# Altium schematic sheet Schematic1_3.SchDoc (part 2 of 3)
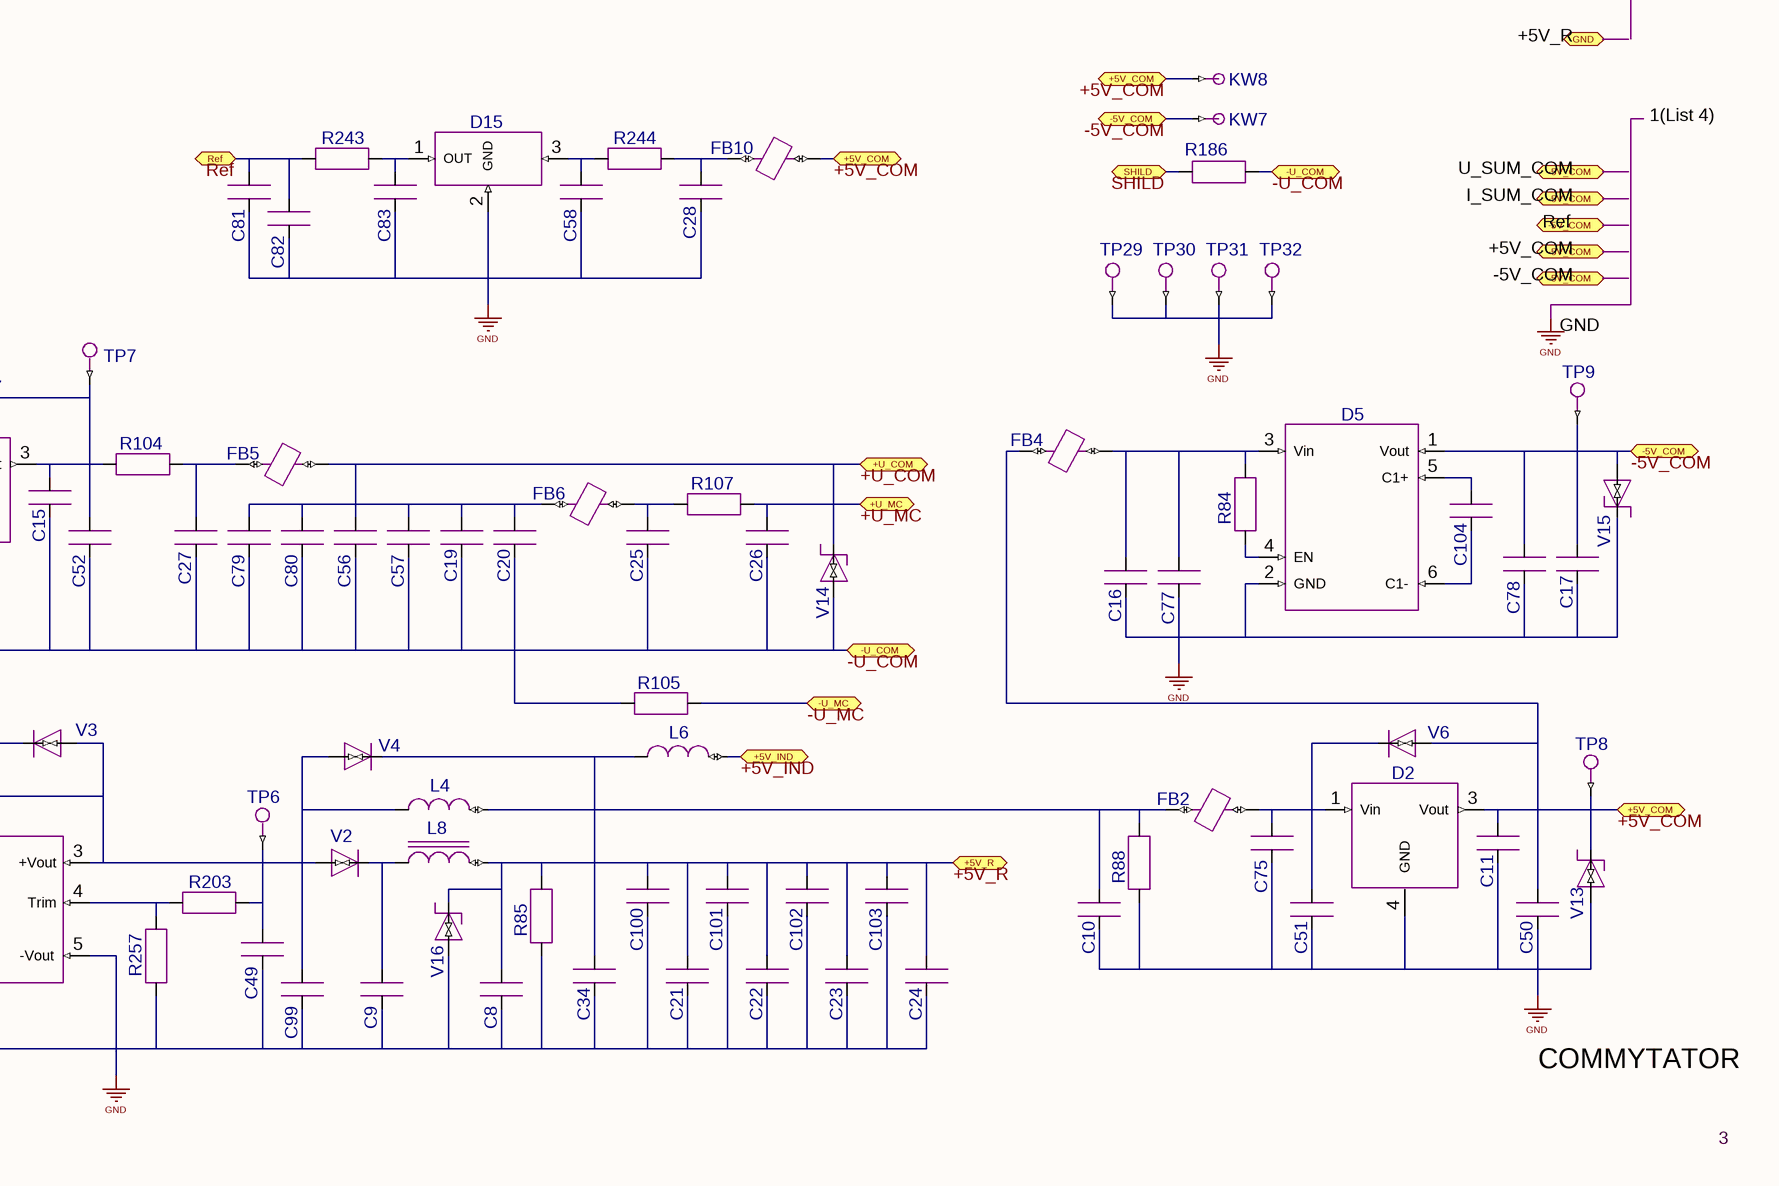
[diagram p3: Schematic1_3.SchDoc, bottom right]
## Library data of the parts
C8 = CAP CER 0.1UF 50V 10% X7R 0603: CL10B104KB8SFNC; Part Label: 100nF VIP; Cell Name: 0603-STANDART-1608; CmpIndex: 20; Ref Designator: C8; Symbol name: C-SXEM-1.1; SymIndex: 6; Part Name: CAP CER 0.1UF 50V 10% X7R 0603; Part Number: CL10B104KB8SFNC
C9 = CAP CER 0.1UF 50V 10% X7R 0603: CL10B104KB8SFNC; Part Label: 100nF VIP; Cell Name: 0603-STANDART-1608; CmpIndex: 76; Ref Designator: C9; Symbol name: C-SXEM-1.1; SymIndex: 6; Part Name: CAP CER 0.1UF 50V 10% X7R 0603; Part Number: CL10B104KB8SFNC
C10 = CAP CER 0.1UF 50V 10% X7R 0603: CL10B104KB8SFNC; Part Label: 100nF VIP; Cell Name: 0603-STANDART-1608; CmpIndex: 82; Ref Designator: C10; Symbol name: C-SXEM-1.1; SymIndex: 6; Part Name: CAP CER 0.1UF 50V 10% X7R 0603; Part Number: CL10B104KB8SFNC
C11 = CAP CER 0.1UF 50V 10% X7R 0603: CL10B104KB8SFNC; Part Label: 100nF VIP; Cell Name: 0603-STANDART-1608; CmpIndex: 87; Ref Designator: C11; Symbol name: C-SXEM-1.1; SymIndex: 6; Part Name: CAP CER 0.1UF 50V 10% X7R 0603; Part Number: CL10B104KB8SFNC
C12 = CAP CER 0.1UF 50V 10% X7R 0603: CL10B104KB8SFNC; Part Label: 100nF VIP; Cell Name: 0603-STANDART-1608; CmpIndex: 103; Ref Designator: C12; Symbol name: C-SXEM-1.1; SymIndex: 6; Part Name: CAP CER 0.1UF 50V 10% X7R 0603; Part Number: CL10B104KB8SFNC
C13 = CAP CER 0.1UF 50V 10% X7R 0603: CL10B104KB8SFNC; Part Label: 100nF VIP; Cell Name: 0603-STANDART-1608; CmpIndex: 104; Ref Designator: C13; Symbol name: C-SXEM-1.1; SymIndex: 6; Part Name: CAP CER 0.1UF 50V 10% X7R 0603; Part Number: CL10B104KB8SFNC
C14 = CAP CER 0.1UF 50V 10% X7R 0603: CL10B104KB8SFNC; Part Label: 100nF VIP; Cell Name: 0603-STANDART-1608; CmpIndex: 105; Ref Designator: C14; Symbol name: C-SXEM-1.1; SymIndex: 6; Part Name: CAP CER 0.1UF 50V 10% X7R 0603; Part Number: CL10B104KB8SFNC
C15 = CAP CER 0.1UF 50V 10% X7R 0603: CL10B104KB8SFNC; Part Label: 100nF VIP; Cell Name: 0603-STANDART-1608; CmpIndex: 113; Ref Designator: C15; Symbol name: C-SXEM-1.1; SymIndex: 6; Part Name: CAP CER 0.1UF 50V 10% X7R 0603; Part Number: CL10B104KB8SFNC
C16 = CAP CER 0.1UF 50V 10% X7R 0603: CL10B104KB8SFNC; Part Label: 100nF VIP; Cell Name: 0603-STANDART-1608; CmpIndex: 119; Ref Designator: C16; Symbol name: C-SXEM-1.1; SymIndex: 6; Part Name: CAP CER 0.1UF 50V 10% X7R 0603; Part Number: CL10B104KB8SFNC
C17 = CAP CER 0.1UF 50V 10% X7R 0603: CL10B104KB8SFNC; Part Label: 100nF VIP; Cell Name: 0603-STANDART-1608; CmpIndex: 120; Ref Designator: C17; Symbol name: C-SXEM-1.1; SymIndex: 6; Part Name: CAP CER 0.1UF 50V 10% X7R 0603; Part Number: CL10B104KB8SFNC
C18 = CAP CER 0.1UF 50V 10% X7R 0603: CL10B104KB8SFNC; Part Label: 100nF VIP; Cell Name: 0603-STANDART-1608; CmpIndex: 129; Ref Designator: C18; Symbol name: C-SXEM-1.1; SymIndex: 6; Part Name: CAP CER 0.1UF 50V 10% X7R 0603; Part Number: CL10B104KB8SFNC
C19 = CAP CER 0.1UF 50V 10% X7R 0603: CL10B104KB8SFNC; Part Label: 100nF VIP; Cell Name: 0603-STANDART-1608; CmpIndex: 184; Ref Designator: C19; Symbol name: C-SXEM-1.1; SymIndex: 6; Part Name: CAP CER 0.1UF 50V 10% X7R 0603; Part Number: CL10B104KB8SFNC
C20 = CAP CER 0.1UF 50V 10% X7R 0603: CL10B104KB8SFNC; Part Label: 100nF VIP; Cell Name: 0603-STANDART-1608; CmpIndex: 190; Ref Designator: C20; Symbol name: C-SXEM-1.1; SymIndex: 6; Part Name: CAP CER 0.1UF 50V 10% X7R 0603; Part Number: CL10B104KB8SFNC
C21 = CAP CER 0.1UF 50V 10% X7R 0603: CL10B104KB8SFNC; Part Label: 100nF VIP; Cell Name: 0603-STANDART-1608; CmpIndex: 213; Ref Designator: C21; Symbol name: C-SXEM-1.1; SymIndex: 6; Part Name: CAP CER 0.1UF 50V 10% X7R 0603; Part Number: CL10B104KB8SFNC
C22 = CAP CER 0.1UF 50V 10% X7R 0603: CL10B104KB8SFNC; Part Label: 100nF VIP; Cell Name: 0603-STANDART-1608; CmpIndex: 214; Ref Designator: C22; Symbol name: C-SXEM-1.1; SymIndex: 6; Part Name: CAP CER 0.1UF 50V 10% X7R 0603; Part Number: CL10B104KB8SFNC
C23 = CAP CER 0.1UF 50V 10% X7R 0603: CL10B104KB8SFNC; Part Label: 100nF VIP; Cell Name: 0603-STANDART-1608; CmpIndex: 215; Ref Designator: C23; Symbol name: C-SXEM-1.1; SymIndex: 6; Part Name: CAP CER 0.1UF 50V 10% X7R 0603; Part Number: CL10B104KB8SFNC
C24 = CAP CER 0.1UF 50V 10% X7R 0603: CL10B104KB8SFNC; Part Label: 100nF VIP; Cell Name: 0603-STANDART-1608; CmpIndex: 216; Ref Designator: C24; Symbol name: C-SXEM-1.1; SymIndex: 6; Part Name: CAP CER 0.1UF 50V 10% X7R 0603; Part Number: CL10B104KB8SFNC
C25 = CAP CER 0.1UF 50V 10% X7R 0603: CL10B104KB8SFNC; Part Label: 100nF VIP; Cell Name: 0603-STANDART-1608; CmpIndex: 217; Ref Designator: C25; Symbol name: C-SXEM-1.1; SymIndex: 6; Part Name: CAP CER 0.1UF 50V 10% X7R 0603; Part Number: CL10B104KB8SFNC
C26 = CAP CER 0.1UF 50V 10% X7R 0603: CL10B104KB8SFNC; Part Label: 100nF VIP; Cell Name: 0603-STANDART-1608; CmpIndex: 218; Ref Designator: C26; Symbol name: C-SXEM-1.1; SymIndex: 6; Part Name: CAP CER 0.1UF 50V 10% X7R 0603; Part Number: CL10B104KB8SFNC
C27 = CAP CER 0.1UF 50V 10% X7R 0603: CL10B104KB8SFNC; Part Label: 100nF VIP; Cell Name: 0603-STANDART-1608; CmpIndex: 219; Ref Designator: C27; Symbol name: C-SXEM-1.1; SymIndex: 6; Part Name: CAP CER 0.1UF 50V 10% X7R 0603; Part Number: CL10B104KB8SFNC
C28 = CAP CER 0.1UF 50V 10% X7R 0603: CL10B104KB8SFNC; Part Label: 100nF VIP; Cell Name: 0603-STANDART-1608; CmpIndex: 237; Ref Designator: C28; Symbol name: C-SXEM-1.1; SymIndex: 6; Part Name: CAP CER 0.1UF 50V 10% X7R 0603; Part Number: CL10B104KB8SFNC
C29 = CAP CER 0.1UF 50V 10% X7R 0603: CL10B104KB8SFNC; Part Label: 100nF VIP; Cell Name: 0603-STANDART-1608; CmpIndex: 835; Ref Designator: C29; Symbol name: C-SXEM-1.1; SymIndex: 6; Part Name: CAP CER 0.1UF 50V 10% X7R 0603; Part Number: CL10B104KB8SFNC
C30 = CAP CER 0.1UF 50V 10% X7R 0603: CL10B104KB8SFNC; Part Label: 100nF VIP; Cell Name: 0603-STANDART-1608; CmpIndex: 1016; Ref Designator: C30; Symbol name: C-SXEM-1.1; SymIndex: 6; Part Name: CAP CER 0.1UF 50V 10% X7R 0603; Part Number: CL10B104KB8SFNC
C31 = CAP CER 0.1UF 50V 10% X7R 0603: CL10B104KB8SFNC; Part Label: 100nF VIP; Cell Name: 0603-STANDART-1608; CmpIndex: 1018; Ref Designator: C31; Symbol name: C-SXEM-1.1; SymIndex: 6; Part Name: CAP CER 0.1UF 50V 10% X7R 0603; Part Number: CL10B104KB8SFNC
C32 = CAP CER 0.1UF 50V 10% X7R 0603: CL10B104KB8SFNC; Part Label: 100nF VIP; Cell Name: 0603-STANDART-1608; CmpIndex: 1035; Ref Designator: C32; Symbol name: C-SXEM-1.1; SymIndex: 6; Part Name: CAP CER 0.1UF 50V 10% X7R 0603; Part Number: CL10B104KB8SFNC
C33 = CAP CER 0.1UF 50V 10% X7R 0603: CL10B104KB8SFNC; Part Label: 100nF VIP; Cell Name: 0603-STANDART-1608; CmpIndex: 1042; Ref Designator: C33; Symbol name: C-SXEM-1.1; SymIndex: 6; Part Name: CAP CER 0.1UF 50V 10% X7R 0603; Part Number: CL10B104KB8SFNC
C34 = CAP CER 0.1UF 50V 10% X7R 0603: CL10B104KB8SFNC; Part Label: 100nF VIP; Cell Name: 0603-STANDART-1608; CmpIndex: 1048; Ref Designator: C34; Symbol name: C-SXEM-1.1; SymIndex: 6; Part Name: CAP CER 0.1UF 50V 10% X7R 0603; Part Number: CL10B104KB8SFNC
C35 = CAP CER 0.1UF 50V 10% X7R 0603: CL10B104KB8SFNC; Part Label: 100nF VIP; Cell Name: 0603-STANDART-1608; CmpIndex: 1374; Ref Designator: C35; Symbol name: C-SXEM-1.1; SymIndex: 6; Part Name: CAP CER 0.1UF 50V 10% X7R 0603; Part Number: CL10B104KB8SFNC
C49 = CAP CER 2.2UF 16V 10% X7R 0805: CL21B225KOFNNNE; Part Label: 2,2u VIP; Cell Name: 0805-STANDART-2012; CmpIndex: 22; Ref Designator: C49; Symbol name: C-SXEM-1.1; SymIndex: 6; Part Name: CAP CER 2.2UF 16V 10% X7R 0805; Part Number: CL21B225KOFNNNE
C50 = CAP CER 2.2UF 16V 10% X7R 0805: CL21B225KOFNNNE; Part Label: 2,2u VIP; Cell Name: 0805-STANDART-2012; CmpIndex: 83; Ref Designator: C50; Symbol name: C-SXEM-1.1; SymIndex: 6; Part Name: CAP CER 2.2UF 16V 10% X7R 0805; Part Number: CL21B225KOFNNNE
C51 = CAP CER 2.2UF 16V 10% X7R 0805: CL21B225KOFNNNE; Part Label: 2,2u VIP; Cell Name: 0805-STANDART-2012; CmpIndex: 84; Ref Designator: C51; Symbol name: C-SXEM-1.1; SymIndex: 6; Part Name: CAP CER 2.2UF 16V 10% X7R 0805; Part Number: CL21B225KOFNNNE
C52 = CAP CER 2.2UF 16V 10% X7R 0805: CL21B225KOFNNNE; Part Label: 2,2u VIP; Cell Name: 0805-STANDART-2012; CmpIndex: 106; Ref Designator: C52; Symbol name: C-SXEM-1.1; SymIndex: 6; Part Name: CAP CER 2.2UF 16V 10% X7R 0805; Part Number: CL21B225KOFNNNE
C53 = CAP CER 2.2UF 16V 10% X7R 0805: CL21B225KOFNNNE; Part Label: 2,2u VIP; Cell Name: 0805-STANDART-2012; CmpIndex: 107; Ref Designator: C53; Symbol name: C-SXEM-1.1; SymIndex: 6; Part Name: CAP CER 2.2UF 16V 10% X7R 0805; Part Number: CL21B225KOFNNNE
C54 = CAP CER 2.2UF 16V 10% X7R 0805: CL21B225KOFNNNE; Part Label: 2,2u VIP; Cell Name: 0805-STANDART-2012; CmpIndex: 108; Ref Designator: C54; Symbol name: C-SXEM-1.1; SymIndex: 6; Part Name: CAP CER 2.2UF 16V 10% X7R 0805; Part Number: CL21B225KOFNNNE
C55 = CAP CER 2.2UF 16V 10% X7R 0805: CL21B225KOFNNNE; Part Label: 2,2u VIP; Cell Name: 0805-STANDART-2012; CmpIndex: 109; Ref Designator: C55; Symbol name: C-SXEM-1.1; SymIndex: 6; Part Name: CAP CER 2.2UF 16V 10% X7R 0805; Part Number: CL21B225KOFNNNE
C56 = CAP CER 2.2UF 16V 10% X7R 0805: CL21B225KOFNNNE; Part Label: 2,2u VIP; Cell Name: 0805-STANDART-2012; CmpIndex: 182; Ref Designator: C56; Symbol name: C-SXEM-1.1; SymIndex: 6; Part Name: CAP CER 2.2UF 16V 10% X7R 0805; Part Number: CL21B225KOFNNNE
C57 = CAP CER 2.2UF 16V 10% X7R 0805: CL21B225KOFNNNE; Part Label: 2,2u VIP; Cell Name: 0805-STANDART-2012; CmpIndex: 189; Ref Designator: C57; Symbol name: C-SXEM-1.1; SymIndex: 6; Part Name: CAP CER 2.2UF 16V 10% X7R 0805; Part Number: CL21B225KOFNNNE
C58 = CAP CER 2.2UF 16V 10% X7R 0805: CL21B225KOFNNNE; Part Label: 2,2u VIP; Cell Name: 0805-STANDART-2012; CmpIndex: 238; Ref Designator: C58; Symbol name: C-SXEM-1.1; SymIndex: 6; Part Name: CAP CER 2.2UF 16V 10% X7R 0805; Part Number: CL21B225KOFNNNE
C59 = CAP CER 2.2UF 16V 10% X7R 0805: CL21B225KOFNNNE; Part Label: 2,2u VIP; Cell Name: 0805-STANDART-2012; CmpIndex: 1033; Ref Designator: C59; Symbol name: C-SXEM-1.1; SymIndex: 6; Part Name: CAP CER 2.2UF 16V 10% X7R 0805; Part Number: CL21B225KOFNNNE
C60 = CAP CER 2.2UF 16V 10% X7R 0805: CL21B225KOFNNNE; Part Label: 2,2u VIP; Cell Name: 0805-STANDART-2012; CmpIndex: 1034; Ref Designator: C60; Symbol name: C-SXEM-1.1; SymIndex: 6; Part Name: CAP CER 2.2UF 16V 10% X7R 0805; Part Number: CL21B225KOFNNNE
C61 = CAP CER 2.2UF 16V 10% X7R 0805: CL21B225KOFNNNE; Part Label: 2,2u VIP; Cell Name: 0805-STANDART-2012; CmpIndex: 1041; Ref Designator: C61; Symbol name: C-SXEM-1.1; SymIndex: 6; Part Name: CAP CER 2.2UF 16V 10% X7R 0805; Part Number: CL21B225KOFNNNE
C62 = CAP CER 2.2UF 16V 10% X7R 0805: CL21B225KOFNNNE; Part Label: 2,2u VIP; Cell Name: 0805-STANDART-2012; CmpIndex: 1355; Ref Designator: C62; Symbol name: C-SXEM-1.1; SymIndex: 6; Part Name: CAP CER 2.2UF 16V 10% X7R 0805; Part Number: CL21B225KOFNNNE
C63 = CAP CER 2.2UF 16V 10% X7R 0805: CL21B225KOFNNNE; Part Label: 2,2u VIP; Cell Name: 0805-STANDART-2012; CmpIndex: 426; Ref Designator: C63; Symbol name: C-SXEM-1.1; SymIndex: 6; Part Name: CAP CER 2.2UF 16V 10% X7R 0805; Part Number: CL21B225KOFNNNE
C64 = CAP CER 1000PF 3KV 10% X7R 1808: C1808X102KHRACTU; Part Label: 1nF/3000V; Cell Name: 1808-STANDART-4520; CmpIndex: 25; Ref Designator: C64; Symbol name: C-SXEM-1.1; SymIndex: 6; Part Name: CAP CER 1000PF 3KV 10% X7R 1808; Part Number: C1808X102KHRACTU
C65 = CAP CER 1000PF 3KV 10% X7R 1808: C1808X102KHRACTU; Part Label: 1nF/3000V; Cell Name: 1808-STANDART-4520; CmpIndex: 26; Ref Designator: C65; Symbol name: C-SXEM-1.1; SymIndex: 6; Part Name: CAP CER 1000PF 3KV 10% X7R 1808; Part Number: C1808X102KHRACTU
C66 = CAP CER 0.1UF 100V X7R 1206: C1206C104K1RACTU; Part Label: 0,1uF/100V; Cell Name: 1206-STANDART-3216; CmpIndex: 68; Ref Designator: C66; Symbol name: C-SXEM-1.1; SymIndex: 6; Part Name: CAP CER 0.1UF 100V X7R 1206; Part Number: C1206C104K1RACTU
C67 = CAP CER 0.1UF 100V X7R 1206: C1206C104K1RACTU; Part Label: 0,1uF/100V; Cell Name: 1206-STANDART-3216; CmpIndex: 69; Ref Designator: C67; Symbol name: C-SXEM-1.1; SymIndex: 6; Part Name: CAP CER 0.1UF 100V X7R 1206; Part Number: C1206C104K1RACTU
C68 = CAP CER 0.1UF 100V X7R 1206: C1206C104K1RACTU; Part Label: 0,1uF/100V; Cell Name: 1206-STANDART-3216; CmpIndex: 70; Ref Designator: C68; Symbol name: C-SXEM-1.1; SymIndex: 6; Part Name: CAP CER 0.1UF 100V X7R 1206; Part Number: C1206C104K1RACTU
C69 = CAP CER 0.1UF 100V X7R 1206: C1206C104K1RACTU; Part Label: 0,1uF/100V; Cell Name: 1206-STANDART-3216; CmpIndex: 71; Ref Designator: C69; Symbol name: C-SXEM-1.1; SymIndex: 6; Part Name: CAP CER 0.1UF 100V X7R 1206; Part Number: C1206C104K1RACTU
C70 = CAP CER 4.7UF 100V X7R 1210: CL32B475KCVZW6E; Part Label: 4,7uF/100V; Cell Name: 1210-STANDART-3225; CmpIndex: 73; Ref Designator: C70; Symbol name: C-SXEM-1.1; SymIndex: 6; Part Name: CAP CER 4.7UF 100V X7R 1210; Part Number: CL32B475KCVZW6E
C71 = CAP CER 4.7UF 100V X7R 1210: CL32B475KCVZW6E; Part Label: 4,7uF/100V; Cell Name: 1210-STANDART-3225; CmpIndex: 74; Ref Designator: C71; Symbol name: C-SXEM-1.1; SymIndex: 6; Part Name: CAP CER 4.7UF 100V X7R 1210; Part Number: CL32B475KCVZW6E
C75 = CAP CER 10UF 16V 10% X7R 0805: CL21B106KOQNNNE; Part Label: 10uF VIP; Cell Name: 0805-STANDART-2012; CmpIndex: 86; Ref Designator: C75; Symbol name: C-SXEM-1.1; SymIndex: 6; Part Name: CAP CER 10UF 16V 10% X7R 0805; Part Number: CL21B106KOQNNNE
C76 = CAP CER 10UF 16V 10% X7R 0805: CL21B106KOQNNNE; Part Label: 10uF VIP; Cell Name: 0805-STANDART-2012; CmpIndex: 111; Ref Designator: C76; Symbol name: C-SXEM-1.1; SymIndex: 6; Part Name: CAP CER 10UF 16V 10% X7R 0805; Part Number: CL21B106KOQNNNE
C77 = CAP CER 10UF 16V 10% X7R 0805: CL21B106KOQNNNE; Part Label: 10uF VIP; Cell Name: 0805-STANDART-2012; CmpIndex: 117; Ref Designator: C77; Symbol name: C-SXEM-1.1; SymIndex: 6; Part Name: CAP CER 10UF 16V 10% X7R 0805; Part Number: CL21B106KOQNNNE
C78 = CAP CER 10UF 16V 10% X7R 0805: CL21B106KOQNNNE; Part Label: 10uF VIP; Cell Name: 0805-STANDART-2012; CmpIndex: 118; Ref Designator: C78; Symbol name: C-SXEM-1.1; SymIndex: 6; Part Name: CAP CER 10UF 16V 10% X7R 0805; Part Number: CL21B106KOQNNNE
C79 = CAP CER 10UF 16V 10% X7R 0805: CL21B106KOQNNNE; Part Label: 10uF VIP; Cell Name: 0805-STANDART-2012; CmpIndex: 187; Ref Designator: C79; Symbol name: C-SXEM-1.1; SymIndex: 6; Part Name: CAP CER 10UF 16V 10% X7R 0805; Part Number: CL21B106KOQNNNE
C80 = CAP CER 10UF 16V 10% X7R 0805: CL21B106KOQNNNE; Part Label: 10uF VIP; Cell Name: 0805-STANDART-2012; CmpIndex: 188; Ref Designator: C80; Symbol name: C-SXEM-1.1; SymIndex: 6; Part Name: CAP CER 10UF 16V 10% X7R 0805; Part Number: CL21B106KOQNNNE
C81 = CAP CER 10UF 16V 10% X7R 0805: CL21B106KOQNNNE; Part Label: 10uF VIP; Cell Name: 0805-STANDART-2012; CmpIndex: 241; Ref Designator: C81; Symbol name: C-SXEM-1.1; SymIndex: 6; Part Name: CAP CER 10UF 16V 10% X7R 0805; Part Number: CL21B106KOQNNNE
C82 = CAP CER 10UF 16V 10% X7R 0805: CL21B106KOQNNNE; Part Label: 10uF VIP; Cell Name: 0805-STANDART-2012; CmpIndex: 242; Ref Designator: C82; Symbol name: C-SXEM-1.1; SymIndex: 6; Part Name: CAP CER 10UF 16V 10% X7R 0805; Part Number: CL21B106KOQNNNE
C83 = CAP CER 10UF 16V 10% X7R 0805: CL21B106KOQNNNE; Part Label: 10uF VIP; Cell Name: 0805-STANDART-2012; CmpIndex: 243; Ref Designator: C83; Symbol name: C-SXEM-1.1; SymIndex: 6; Part Name: CAP CER 10UF 16V 10% X7R 0805; Part Number: CL21B106KOQNNNE
C84 = CAP CER 10UF 16V 10% X7R 0805: CL21B106KOQNNNE; Part Label: 10uF VIP; Cell Name: 0805-STANDART-2012; CmpIndex: 836; Ref Designator: C84; Symbol name: C-SXEM-1.1; SymIndex: 6; Part Name: CAP CER 10UF 16V 10% X7R 0805; Part Number: CL21B106KOQNNNE
C85 = CAP CER 10UF 16V 10% X7R 0805: CL21B106KOQNNNE; Part Label: 10uF VIP; Cell Name: 0805-STANDART-2012; CmpIndex: 1017; Ref Designator: C85; Symbol name: C-SXEM-1.1; SymIndex: 6; Part Name: CAP CER 10UF 16V 10% X7R 0805; Part Number: CL21B106KOQNNNE
C86 = CAP CER 10UF 16V 10% X7R 0805: CL21B106KOQNNNE; Part Label: 10uF VIP; Cell Name: 0805-STANDART-2012; CmpIndex: 1375; Ref Designator: C86; Symbol name: C-SXEM-1.1; SymIndex: 6; Part Name: CAP CER 10UF 16V 10% X7R 0805; Part Number: CL21B106KOQNNNE
C98 = CAP CER 10UF 25V 10% X7R 1210: GRM32DR71E106KA12L; Cell Name: 1210-STANDART-3225; CmpIndex: 99; Ref Designator: C98; Symbol name: C-SXEM-1.1; SymIndex: 6; Part Label: 10uF; Part Name: CAP CER 10UF 25V 10% X7R 1210; Part Number: GRM32DR71E106KA12L
C99 = CAP CER 10UF 25V 10% X7R 1210: GRM32DR71E106KA12L; Cell Name: 1210-STANDART-3225; CmpIndex: 114; Ref Designator: C99; Symbol name: C-SXEM-1.1; SymIndex: 6; Part Label: 10uF; Part Name: CAP CER 10UF 25V 10% X7R 1210; Part Number: GRM32DR71E106KA12L
C100 = CAP CER 10UF 25V 10% X7R 1210: GRM32DR71E106KA12L; Cell Name: 1210-STANDART-3225; CmpIndex: 191; Ref Designator: C100; Symbol name: C-SXEM-1.1; SymIndex: 6; Part Label: 10uF; Part Name: CAP CER 10UF 25V 10% X7R 1210; Part Number: GRM32DR71E106KA12L
C101 = CAP CER 10UF 25V 10% X7R 1210: GRM32DR71E106KA12L; Cell Name: 1210-STANDART-3225; CmpIndex: 210; Ref Designator: C101; Symbol name: C-SXEM-1.1; SymIndex: 6; Part Label: 10uF; Part Name: CAP CER 10UF 25V 10% X7R 1210; Part Number: GRM32DR71E106KA12L
C102 = CAP CER 10UF 25V 10% X7R 1210: GRM32DR71E106KA12L; Cell Name: 1210-STANDART-3225; CmpIndex: 211; Ref Designator: C102; Symbol name: C-SXEM-1.1; SymIndex: 6; Part Label: 10uF; Part Name: CAP CER 10UF 25V 10% X7R 1210; Part Number: GRM32DR71E106KA12L
C103 = CAP CER 10UF 25V 10% X7R 1210: GRM32DR71E106KA12L; Cell Name: 1210-STANDART-3225; CmpIndex: 212; Ref Designator: C103; Symbol name: C-SXEM-1.1; SymIndex: 6; Part Label: 10uF; Part Name: CAP CER 10UF 25V 10% X7R 1210; Part Number: GRM32DR71E106KA12L
C104 = CAP CER 1UF 16V 10% X7R 0805: CC0805KKX7R7BB105; Part Label: 1u F VIP; Cell Name: 0805-STANDART-2012; CmpIndex: 123; Ref Designator: C104; Symbol name: C-SXEM-1.1; SymIndex: 6; Part Name: CAP CER 1UF 16V 10% X7R 0805; Part Number: CC0805KKX7R7BB105
C135 = CAP CER 1000PF 50V 5% NP0 0603: GRM1885C1H102JA01D; Part Label: 1nF; Cell Name: 0603-STANDART-1608; CmpIndex: 1014; Ref Designator: C135; Symbol name: C-SXEM-1.1; SymIndex: 6; Part Name: CAP CER 1000PF 50V 5% NP0 0603; Part Number: GRM1885C1H102JA01D
C141 = CAP CER 2200PF 50V 5% NP0 0805: GRM2165C1H222JA01D; Part Label: 2,2nF; Cell Name: 0805-STANDART-2012; CmpIndex: 1019; Ref Designator: C141; Symbol name: C-SXEM-1.1; SymIndex: 6; Part Name: CAP CER 2200PF 50V 5% NP0 0805; Part Number: GRM2165C1H222JA01D
C142 = CAP ALUM 1000UF 63V 20% RADIAL: UHE1H102MHD6_1; Part Label: 1000uF/63V-HE; Cell Name: CAP-EL-L7.5-D18,0; CmpIndex: 1419; Ref Designator: C142; Symbol name: C-SXEM-EL-1.1; SymIndex: 41; Part Name: CAP ALUM 1000UF 63V 20% RADIAL; Part Number: UHE1H102MHD6_1
C143 = CAP ALUM 1000UF 63V 20% RADIAL: UHE1H102MHD6_1; Part Label: 1000uF/63V-HE; Cell Name: CAP-EL-L7.5-D18,0; CmpIndex: 1420; Ref Designator: C143; Symbol name: C-SXEM-EL-1.1; SymIndex: 41; Part Name: CAP ALUM 1000UF 63V 20% RADIAL; Part Number: UHE1H102MHD6_1
D1 = DC/DC CONVERTER 5V 10W: PDQ10-Q48-S5-D; Part Label: 5V/2A_18-75V; Cell Name: THN-30; CmpIndex: 33; Ref Designator: D1; Symbol name: TEN30_TEN20.1; SymIndex: 53; Part Name: DC/DC CONVERTER 5V 10W; Part Number: PDQ10-Q48-S5-D
D2 = IC REG LDO 5V 0.5A DPAK: NCP5501DT50RKG; Part Label: 5V0/0,5A; Cell Name: DPAK-3-TO252-ONSEMI; CmpIndex: 85; Ref Designator: D2; Symbol name: LDO-DPAK-1IN-3OUT-4GND.1; SymIndex: 21; Part Name: IC REG LDO 5V 0.5A DPAK; Part Number: NCP5501DT50RKG
D3 = IC REG LDO 5V 0.5A DPAK: NCP5501DT50RKG; Part Label: 5V0/0,5A; Cell Name: DPAK-3-TO252-ONSEMI; CmpIndex: 110; Ref Designator: D3; Symbol name: LDO-DPAK-1IN-3OUT-4GND.1; SymIndex: 21; Part Name: IC REG LDO 5V 0.5A DPAK; Part Number: NCP5501DT50RKG
D4 = IC REG ISOLATED 7V 286MA 12SOP: DCP020507U; Part Label: 5Vin/7Vout/286mA; Cell Name: DVB-R-PDSO-G12/G28; CmpIndex: 96; Ref Designator: D4; Symbol name: DCP02-SOIC.1; SymIndex: 17; Part Name: IC REG ISOLATED 7V 286MA 12SOP; Part Number: DCP020507U
D5 = IC REG SWTCHD CAP INV 6SOT23: LM2776DBVR; Part Label: -5V; Cell Name: DBV_R-PDSO-G6; CmpIndex: 115; Ref Designator: D5; Symbol name: LM2776.1; SymIndex: 55; Part Name: IC REG SWTCHD CAP INV 6SOT23; Part Number: LM2776DBVR
D6 = IC SWITCH DUAL SPDT 10MSOP: ADG736BRMZ-REEL7; Part Label: +5V/4OHM; Cell Name: MSOP-RM-10-AD; CmpIndex: 232; Ref Designator: D6; Symbol name: ADG736.1; SymIndex: 63; Part Name: IC SWITCH DUAL SPDT 10MSOP; Part Number: ADG736BRMZ-REEL7
D9 = IC GATE AND 1CH 2-INP SOT-23-5: SN74LVC1G08DBVR; Part Label: 5V/32mA; Cell Name: SOT-23-DBV-R-PDSO-G5-TI; CmpIndex: 233; Ref Designator: D9; Symbol name: 1IN_AND_GATE.1; SymIndex: 60; Part Name: IC GATE AND 1CH 2-INP SOT-23-5; Part Number: SN74LVC1G08DBVR
D10 = IC GATE AND 1CH 2-INP SOT-23-5: SN74LVC1G08DBVR; Part Label: 5V/32mA; Cell Name: SOT-23-DBV-R-PDSO-G5-TI; CmpIndex: 1007; Ref Designator: D10; Symbol name: 1IN_AND_GATE.1; SymIndex: 60; Part Name: IC GATE AND 1CH 2-INP SOT-23-5; Part Number: SN74LVC1G08DBVR
D11 = IC GATE AND 1CH 2-INP SOT-23-5: SN74LVC1G08DBVR; Part Label: 5V/32mA; Cell Name: SOT-23-DBV-R-PDSO-G5-TI; CmpIndex: 1027; Ref Designator: D11; Symbol name: 1IN_AND_GATE.1; SymIndex: 60; Part Name: IC GATE AND 1CH 2-INP SOT-23-5; Part Number: SN74LVC1G08DBVR
D12 = IC GATE AND 1CH 2-INP SOT-23-5: SN74LVC1G08DBVR; Part Label: 5V/32mA; Cell Name: SOT-23-DBV-R-PDSO-G5-TI; CmpIndex: 1040; Ref Designator: D12; Symbol name: 1IN_AND_GATE.1; SymIndex: 60; Part Name: IC GATE AND 1CH 2-INP SOT-23-5; Part Number: SN74LVC1G08DBVR
D13 = IC GATE AND 1CH 2-INP SOT-23-5: SN74LVC1G08DBVR; Part Label: 5V/32mA; Cell Name: SOT-23-DBV-R-PDSO-G5-TI; CmpIndex: 1043; Ref Designator: D13; Symbol name: 1IN_AND_GATE.1; SymIndex: 60; Part Name: IC GATE AND 1CH 2-INP SOT-23-5; Part Number: SN74LVC1G08DBVR
D15 = VREF 2.5V 2mV  70uA 50ppm  SOT-23-3: AD1582BRTZ-REEL7; Part Label: 2,5V/50ppm; Cell Name: SOT-23-RT-3-AD; CmpIndex: 239; Ref Designator: D15; Symbol name: AD1582-1585.1; SymIndex: 64; Part Name: VREF 2.5V 2mV  70uA 50ppm  SOT-23-3; Part Number: AD1582BRTZ-REEL7
D22 = IC GATE NAND 1CH 2-INP SOT-23-5: SN74AHCT1G00DBVR; Part Label: 5V/8mA; Cell Name: SOT-23-DBV-R-PDSO-G5-TI; CmpIndex: 1025; Ref Designator: D22; Symbol name: 1IN_NAND_GATE.1; SymIndex: 59; Part Name: IC GATE NAND 1CH 2-INP SOT-23-5; Part Number: SN74AHCT1G00DBVR
D23 = IC GATE NAND 1CH 2-INP SOT-23-5: SN74AHCT1G00DBVR; Part Label: 5V/8mA; Cell Name: SOT-23-DBV-R-PDSO-G5-TI; CmpIndex: 1031; Ref Designator: D23; Symbol name: 1IN_NAND_GATE.1; SymIndex: 59; Part Name: IC GATE NAND 1CH 2-INP SOT-23-5; Part Number: SN74AHCT1G00DBVR
D36 = IC SIMPLE SEQUENCER OD SC70-6: ADM1087AKSZ-REEL7; Part Label: 1K/OPEN; Cell Name: SC-70-KS-6-AD; CmpIndex: 997; Ref Designator: D36; Symbol name: ADM1087-1088.1; SymIndex: 62; Part Name: IC SIMPLE SEQUENCER OD SC70-6; Part Number: ADM1087AKSZ-REEL7
D37 = IC GATE NAND 1CH 2-INP SOT-23-5: SN74LVC1G00DBVR; Part Label: 5V/32mA; CmpIndex: 1020; Ref Designator: D37; Symbol name: 1IN_NAND_GATE.1; SymIndex: 59; Part Name: IC GATE NAND 1CH 2-INP SOT-23-5; Part Number: SN74LVC1G00DBVR
D38 = ERROR_5.30mm Width: SN74ABT245BNSR; Part Label: ERROR_4.4mm Width; Cell Name: PW-R-PDSO-G20; CmpIndex: 1066; Ref Designator: D38; Symbol name: SN74HCT245.1; SymIndex: 29; Part Name: ERROR_5.30mm Width; Part Number: SN74ABT245BNSR
D39 = ERROR_5.30mm Width: SN74ABT245BNSR; Part Label: ERROR_4.4mm Width; Cell Name: PW-R-PDSO-G20; CmpIndex: 1082; Ref Designator: D39; Symbol name: SN74HCT245.1; SymIndex: 29; Part Name: ERROR_5.30mm Width; Part Number: SN74ABT245BNSR
FB2 = FERRITE BEAD 1000 OHM 0,4 A 0603: MMZ1608S102A; Part Label: 1K/0,4A; Cell Name: 0603-STANDART-1608; CmpIndex: 80; Ref Designator: FB2; Symbol name: FERRITE-1.1; SymIndex: 10; Part Name: FERRITE BEAD 1000 OHM 0,4 A 0603; Part Number: MMZ1608S102A
FB3 = FERRITE BEAD 1000 OHM 0,4 A 0603: MMZ1608S102A; Part Label: 1K/0,4A; Cell Name: 0603-STANDART-1608; CmpIndex: 101; Ref Designator: FB3; Symbol name: FERRITE-1.1; SymIndex: 10; Part Name: FERRITE BEAD 1000 OHM 0,4 A 0603; Part Number: MMZ1608S102A
FB4 = FERRITE BEAD 1000 OHM 0,4 A 0603: MMZ1608S102A; Part Label: 1K/0,4A; Cell Name: 0603-STANDART-1608; CmpIndex: 121; Ref Designator: FB4; Symbol name: FERRITE-1.1; SymIndex: 10; Part Name: FERRITE BEAD 1000 OHM 0,4 A 0603; Part Number: MMZ1608S102A
FB5 = FERRITE BEAD 1000 OHM 0,4 A 0603: MMZ1608S102A; Part Label: 1K/0,4A; Cell Name: 0603-STANDART-1608; CmpIndex: 879; Ref Designator: FB5; Symbol name: FERRITE-1.1; SymIndex: 10; Part Name: FERRITE BEAD 1000 OHM 0,4 A 0603; Part Number: MMZ1608S102A
FB6 = FERRITE BEAD 1000 OHM 0,4 A 0603: MMZ1608S102A; Part Label: 1K/0,4A; Cell Name: 0603-STANDART-1608; CmpIndex: 880; Ref Designator: FB6; Symbol name: FERRITE-1.1; SymIndex: 10; Part Name: FERRITE BEAD 1000 OHM 0,4 A 0603; Part Number: MMZ1608S102A
FB7 = FERRITE BEAD 1000 OHM 0,4 A 0603: MMZ1608S102A; Part Label: 1K/0,4A; Cell Name: 0603-STANDART-1608; CmpIndex: 1377; Ref Designator: FB7; Symbol name: FERRITE-1.1; SymIndex: 10; Part Name: FERRITE BEAD 1000 OHM 0,4 A 0603; Part Number: MMZ1608S102A
FB10 = FERRITE BEAD 1800 OHM 0,2 A 0603: MMZ1608A182B; Part Label: 1,8K/0,2A; Cell Name: 0603-STANDART-1608; CmpIndex: 240; Ref Designator: FB10; Symbol name: FERRITE-1.1; SymIndex: 10; Part Name: FERRITE BEAD 1800 OHM 0,2 A 0603; Part Number: MMZ1608A182B
FB11 = FERRITE BEAD 1800 OHM 0,2 A 0603: MMZ1608A182B; Part Label: 1,8K/0,2A; Cell Name: 0603-STANDART-1608; CmpIndex: 1029; Ref Designator: FB11; Symbol name: FERRITE-1.1; SymIndex: 10; Part Name: FERRITE BEAD 1800 OHM 0,2 A 0603; Part Number: MMZ1608A182B
FB12 = FERRITE BEAD 1800 OHM 0,2 A 0603: MMZ1608A182B; Part Label: 1,8K/0,2A; Cell Name: 0603-STANDART-1608; CmpIndex: 1030; Ref Designator: FB12; Symbol name: FERRITE-1.1; SymIndex: 10; Part Name: FERRITE BEAD 1800 OHM 0,2 A 0603; Part Number: MMZ1608A182B
H1 = LED 2X1.2MM 570NM GN WTR CLR SMD: APT2012CGCK; Part Label: GREEN/20mA/50mcd; Cell Name: 0805-STANDART-2012-SVET; CmpIndex: 32; Ref Designator: H1; Symbol name: SVETODIODE_1A_2K.1; SymIndex: 16; Part Name: LED 2X1.2MM 570NM GN WTR CLR SMD; Part Number: APT2012CGCK
H2 = LED 2X1.2MM 570NM GN WTR CLR SMD: APT2012CGCK; Part Label: GREEN/20mA/50mcd; Cell Name: 0805-STANDART-2012-SVET; CmpIndex: 881; Ref Designator: H2; Symbol name: SVETODIODE_1A_2K.1; SymIndex: 16; Part Name: LED 2X1.2MM 570NM GN WTR CLR SMD; Part Number: APT2012CGCK
H3 = LED 2X1.2MM 570NM GN WTR CLR SMD: APT2012CGCK; Part Label: GREEN/20mA/50mcd; Cell Name: 0805-STANDART-2012-SVET; CmpIndex: 884; Ref Designator: H3; Symbol name: SVETODIODE_1A_2K.1; SymIndex: 16; Part Name: LED 2X1.2MM 570NM GN WTR CLR SMD; Part Number: APT2012CGCK
H4 = LED 2X1.2MM 570NM GN WTR CLR SMD: APT2012CGCK; Part Label: GREEN/20mA/50mcd; Cell Name: 0805-STANDART-2012-SVET; CmpIndex: 925; Ref Designator: H4; Symbol name: SVETODIODE_1A_2K.1; SymIndex: 16; Part Name: LED 2X1.2MM 570NM GN WTR CLR SMD; Part Number: APT2012CGCK
H21 = LED 2X1.2MM 640NM RD WTR CLR SMD: APT2012SRCPRV; Part Label: RED/20mA/100mcd; Cell Name: 0805-STANDART-2012-SVET; CmpIndex: 1057; Ref Designator: H21; Symbol name: SVETODIODE_1A_2K.1; SymIndex: 16; Part Name: LED 2X1.2MM 640NM RD WTR CLR SMD; Part Number: APT2012SRCPRV
H22 = White LED Indication - Discrete 3.1V 0805: QBLP631-IW; Part Label: Yellow; Cell Name: 0805-STANDART-2012-SVET; CmpIndex: 1056; Ref Designator: H22; Symbol name: SVETODIODE_1A_2K.1; SymIndex: 16; Part Name: White LED Indication - Discrete 3.1V 0805; Part Number: QBLP631-IW
KW4 = MGSHV-0_12-D1_3xd0.45: CmpIndex: 457; Ref Designator: KW4; Symbol name: KONT-PROVOD.1; SymIndex: 77; Part Name: MGSHV-0_12-D1_3xd0.45; Part Number: MGSHV-0_12-D1_3xd0.45
KW5 = MGSHV-0_12-D1_3xd0.45: CmpIndex: 458; Ref Designator: KW5; Symbol name: KONT-PROVOD.1; SymIndex: 77; Part Name: MGSHV-0_12-D1_3xd0.45; Part Number: MGSHV-0_12-D1_3xd0.45
KW6 = MGSHV-0_12-D1_3xd0.45: CmpIndex: 459; Ref Designator: KW6; Symbol name: KONT-PROVOD.1; SymIndex: 77; Part Name: MGSHV-0_12-D1_3xd0.45; Part Number: MGSHV-0_12-D1_3xd0.45
KW7 = MGSHV-0_12-D1_3xd0.45: CmpIndex: 463; Ref Designator: KW7; Symbol name: KONT-PROVOD.1; SymIndex: 77; Part Name: MGSHV-0_12-D1_3xd0.45; Part Number: MGSHV-0_12-D1_3xd0.45
KW8 = MGSHV-0_12-D1_3xd0.45: CmpIndex: 465; Ref Designator: KW8; Symbol name: KONT-PROVOD.1; SymIndex: 77; Part Name: MGSHV-0_12-D1_3xd0.45; Part Number: MGSHV-0_12-D1_3xd0.45
KW9 = MGSHV-0_2-D1_6xd0.62_d1,7: MGSHV-0_2-D1_6xd0.62_d1_7; CmpIndex: 468; Ref Designator: KW9; Symbol name: KONT-PROVOD.1; SymIndex: 77; Part Name: MGSHV-0_2-D1_6xd0.62_d1,7; Part Number: MGSHV-0_2-D1_6xd0.62_d1_7
KW10 = MGSHV-0_2-D1_6xd0.62_d1,7: MGSHV-0_2-D1_6xd0.62_d1_7; CmpIndex: 470; Ref Designator: KW10; Symbol name: KONT-PROVOD.1; SymIndex: 77; Part Name: MGSHV-0_2-D1_6xd0.62_d1,7; Part Number: MGSHV-0_2-D1_6xd0.62_d1_7
L1 = INDUCTOR COMMON MODE 10UH 1.6A: SRF0905-100Y; Part Label: 10UH/1,6A; Cell Name: SR0905; CmpIndex: 21; Ref Designator: L1; Symbol name: SFR0905.1; SymIndex: 19; Part Name: INDUCTOR COMMON MODE 10UH 1.6A; Part Number: SRF0905-100Y
L2 = INDUCTOR 1UH 20% 0,75A 0,06R1210: NLFV32T-1R0M-EF; Part Label: 1uH/0,75A; Cell Name: 1210-STANDART-3225; CmpIndex: 23; Ref Designator: L2; Symbol name: L-SXEM-K-1.1; SymIndex: 4; Part Name: INDUCTOR 1UH 20% 0,75A 0,06R1210; Part Number: NLFV32T-1R0M-EF
L3 = INDUCTOR 1UH 20% 0,75A 0,06R1210: NLFV32T-1R0M-EF; Part Label: 1uH/0,75A; Cell Name: 1210-STANDART-3225; CmpIndex: 112; Ref Designator: L3; Symbol name: L-SXEM-K-1.1; SymIndex: 4; Part Name: INDUCTOR 1UH 20% 0,75A 0,06R1210; Part Number: NLFV32T-1R0M-EF
L4 = INDUCTOR 1UH 20% 0,75A 0,06R1210: NLFV32T-1R0M-EF; Part Label: 1uH/0,75A; Cell Name: 1210-STANDART-3225; CmpIndex: 828; Ref Designator: L4; Symbol name: L-SXEM-K-1.1; SymIndex: 4; Part Name: INDUCTOR 1UH 20% 0,75A 0,06R1210; Part Number: NLFV32T-1R0M-EF
L5 = INDUCTOR 1UH 20% 0,75A 0,06R1210: NLFV32T-1R0M-EF; Part Label: 1uH/0,75A; Cell Name: 1210-STANDART-3225; CmpIndex: 830; Ref Designator: L5; Symbol name: L-SXEM-K-1.1; SymIndex: 4; Part Name: INDUCTOR 1UH 20% 0,75A 0,06R1210; Part Number: NLFV32T-1R0M-EF
L6 = INDUCTOR 1UH 20% 0,75A 0,06R1210: NLFV32T-1R0M-EF; Part Label: 1uH/0,75A; Cell Name: 1210-STANDART-3225; CmpIndex: 838; Ref Designator: L6; Symbol name: L-SXEM-K-1.1; SymIndex: 4; Part Name: INDUCTOR 1UH 20% 0,75A 0,06R1210; Part Number: NLFV32T-1R0M-EF
L7 = INDUCTOR 1UH 20% 0,75A 0,06R1210: NLFV32T-1R0M-EF; Part Label: 1uH/0,75A; Cell Name: 1210-STANDART-3225; CmpIndex: 1421; Ref Designator: L7; Symbol name: L-SXEM-K-1.1; SymIndex: 4; Part Name: INDUCTOR 1UH 20% 0,75A 0,06R1210; Part Number: NLFV32T-1R0M-EF
L8 = FIXED IND 22UH 2.5A 133 MOHM SMD: SRP6540-220M; Part Label: 22uH/2A; Cell Name: 6540_SRP_SERIES_7t5x6t5_H4; CmpIndex: 255; Ref Designator: L8; Symbol name: L-SXEM-K-2.1; SymIndex: 7; Part Name: FIXED IND 22UH 2.5A 133 MOHM SMD; Part Number: SRP6540-220M
R35 = RES 20K OHM 1/4W 5% 1206 SMD: ERJ-8GEYJ203V; Cell Name: 1206-STANDART-3216; CmpIndex: 46; Ref Designator: R35; Symbol name: R-SXEM-1.1; SymIndex: 1; Part Label: 20K; Part Name: RES 20K OHM 1/4W 5% 1206 SMD; Part Number: ERJ-8GEYJ203V
R36 = RES 20K OHM 1/4W 5% 1206 SMD: ERJ-8GEYJ203V; Cell Name: 1206-STANDART-3216; CmpIndex: 47; Ref Designator: R36; Symbol name: R-SXEM-1.1; SymIndex: 1; Part Label: 20K; Part Name: RES 20K OHM 1/4W 5% 1206 SMD; Part Number: ERJ-8GEYJ203V
R37 = RES 20K OHM 1/4W 5% 1206 SMD: ERJ-8GEYJ203V; Cell Name: 1206-STANDART-3216; CmpIndex: 48; Ref Designator: R37; Symbol name: R-SXEM-1.1; SymIndex: 1; Part Label: 20K; Part Name: RES 20K OHM 1/4W 5% 1206 SMD; Part Number: ERJ-8GEYJ203V
R38 = RES 20K OHM 1/4W 5% 1206 SMD: ERJ-8GEYJ203V; Cell Name: 1206-STANDART-3216; CmpIndex: 61; Ref Designator: R38; Symbol name: R-SXEM-1.1; SymIndex: 1; Part Label: 20K; Part Name: RES 20K OHM 1/4W 5% 1206 SMD; Part Number: ERJ-8GEYJ203V
R39 = RES 20K OHM 1/4W 5% 1206 SMD: ERJ-8GEYJ203V; Cell Name: 1206-STANDART-3216; CmpIndex: 62; Ref Designator: R39; Symbol name: R-SXEM-1.1; SymIndex: 1; Part Label: 20K; Part Name: RES 20K OHM 1/4W 5% 1206 SMD; Part Number: ERJ-8GEYJ203V
R40 = RES 20K OHM 1/4W 5% 1206 SMD: ERJ-8GEYJ203V; Cell Name: 1206-STANDART-3216; CmpIndex: 63; Ref Designator: R40; Symbol name: R-SXEM-1.1; SymIndex: 1; Part Label: 20K; Part Name: RES 20K OHM 1/4W 5% 1206 SMD; Part Number: ERJ-8GEYJ203V
R84 = RES 4.70K OHM 1/10W 1% 0603 SMD: ERJ-3EKF4701V; Part Label: 4,7K; Cell Name: 0603-STANDART-1608; CmpIndex: 122; Ref Designator: R84; Symbol name: R-SXEM-1.1; SymIndex: 1; Part Name: RES 4.70K OHM 1/10W 1% 0603 SMD; Part Number: ERJ-3EKF4701V
R85 = RES 4.70K OHM 1/10W 1% 0603 SMD: ERJ-3EKF4701V; Part Label: 4,7K; Cell Name: 0603-STANDART-1608; CmpIndex: 808; Ref Designator: R85; Symbol name: R-SXEM-1.1; SymIndex: 1; Part Name: RES 4.70K OHM 1/10W 1% 0603 SMD; Part Number: ERJ-3EKF4701V
R86 = RES 4.70K OHM 1/10W 1% 0603 SMD: ERJ-3EKF4701V; Part Label: 4,7K; Cell Name: 0603-STANDART-1608; CmpIndex: 815; Ref Designator: R86; Symbol name: R-SXEM-1.1; SymIndex: 1; Part Name: RES 4.70K OHM 1/10W 1% 0603 SMD; Part Number: ERJ-3EKF4701V
R87 = RES 4.70K OHM 1/10W 1% 0603 SMD: ERJ-3EKF4701V; Part Label: 4,7K; Cell Name: 0603-STANDART-1608; CmpIndex: 816; Ref Designator: R87; Symbol name: R-SXEM-1.1; SymIndex: 1; Part Name: RES 4.70K OHM 1/10W 1% 0603 SMD; Part Number: ERJ-3EKF4701V
R88 = RES 4.70K OHM 1/10W 1% 0603 SMD: ERJ-3EKF4701V; Part Label: 4,7K; Cell Name: 0603-STANDART-1608; CmpIndex: 827; Ref Designator: R88; Symbol name: R-SXEM-1.1; SymIndex: 1; Part Name: RES 4.70K OHM 1/10W 1% 0603 SMD; Part Number: ERJ-3EKF4701V
R89 = RES 4.70K OHM 1/10W 1% 0603 SMD: ERJ-3EKF4701V; Part Label: 4,7K; Cell Name: 0603-STANDART-1608; CmpIndex: 832; Ref Designator: R89; Symbol name: R-SXEM-1.1; SymIndex: 1; Part Name: RES 4.70K OHM 1/10W 1% 0603 SMD; Part Number: ERJ-3EKF4701V
R90 = RES 4.70K OHM 1/10W 1% 0603 SMD: ERJ-3EKF4701V; Part Label: 4,7K; Cell Name: 0603-STANDART-1608; CmpIndex: 833; Ref Designator: R90; Symbol name: R-SXEM-1.1; SymIndex: 1; Part Name: RES 4.70K OHM 1/10W 1% 0603 SMD; Part Number: ERJ-3EKF4701V
R91 = RES 4.70K OHM 1/10W 1% 0603 SMD: ERJ-3EKF4701V; Part Label: 4,7K; Cell Name: 0603-STANDART-1608; CmpIndex: 834; Ref Designator: R91; Symbol name: R-SXEM-1.1; SymIndex: 1; Part Name: RES 4.70K OHM 1/10W 1% 0603 SMD; Part Number: ERJ-3EKF4701V
R92 = RES 4.70K OHM 1/10W 1% 0603 SMD: ERJ-3EKF4701V; Part Label: 4,7K; Cell Name: 0603-STANDART-1608; CmpIndex: 1011; Ref Designator: R92; Symbol name: R-SXEM-1.1; SymIndex: 1; Part Name: RES 4.70K OHM 1/10W 1% 0603 SMD; Part Number: ERJ-3EKF4701V
R93 = RES 4.70K OHM 1/10W 1% 0603 SMD: ERJ-3EKF4701V; Part Label: 4,7K; Cell Name: 0603-STANDART-1608; CmpIndex: 1012; Ref Designator: R93; Symbol name: R-SXEM-1.1; SymIndex: 1; Part Name: RES 4.70K OHM 1/10W 1% 0603 SMD; Part Number: ERJ-3EKF4701V
R94 = RES 4.70K OHM 1/10W 1% 0603 SMD: ERJ-3EKF4701V; Part Label: 4,7K; Cell Name: 0603-STANDART-1608; CmpIndex: 1023; Ref Designator: R94; Symbol name: R-SXEM-1.1; SymIndex: 1; Part Name: RES 4.70K OHM 1/10W 1% 0603 SMD; Part Number: ERJ-3EKF4701V
R95 = RES 4.70K OHM 1/10W 1% 0603 SMD: ERJ-3EKF4701V; Part Label: 4,7K; Cell Name: 0603-STANDART-1608; CmpIndex: 1024; Ref Designator: R95; Symbol name: R-SXEM-1.1; SymIndex: 1; Part Name: RES 4.70K OHM 1/10W 1% 0603 SMD; Part Number: ERJ-3EKF4701V
R96 = RES 4.70K OHM 1/10W 1% 0603 SMD: ERJ-3EKF4701V; Part Label: 4,7K; Cell Name: 0603-STANDART-1608; CmpIndex: 1054; Ref Designator: R96; Symbol name: R-SXEM-1.1; SymIndex: 1; Part Name: RES 4.70K OHM 1/10W 1% 0603 SMD; Part Number: ERJ-3EKF4701V
R97 = RES 4.70K OHM 1/10W 1% 0603 SMD: ERJ-3EKF4701V; Part Label: 4,7K; Cell Name: 0603-STANDART-1608; CmpIndex: 1055; Ref Designator: R97; Symbol name: R-SXEM-1.1; SymIndex: 1; Part Name: RES 4.70K OHM 1/10W 1% 0603 SMD; Part Number: ERJ-3EKF4701V
R98 = RES 4.70K OHM 1/10W 1% 0603 SMD: ERJ-3EKF4701V; Part Label: 4,7K; Cell Name: 0603-STANDART-1608; CmpIndex: 1067; Ref Designator: R98; Symbol name: R-SXEM-1.1; SymIndex: 1; Part Name: RES 4.70K OHM 1/10W 1% 0603 SMD; Part Number: ERJ-3EKF4701V
R99 = RES 4.70K OHM 1/10W 1% 0603 SMD: ERJ-3EKF4701V; Part Label: 4,7K; Cell Name: 0603-STANDART-1608; CmpIndex: 1083; Ref Designator: R99; Symbol name: R-SXEM-1.1; SymIndex: 1; Part Name: RES 4.70K OHM 1/10W 1% 0603 SMD; Part Number: ERJ-3EKF4701V
R100 = RES 4.70K OHM 1/10W 1% 0603 SMD: ERJ-3EKF4701V; Part Label: 4,7K; Cell Name: 0603-STANDART-1608; CmpIndex: 449; Ref Designator: R100; Symbol name: R-SXEM-1.1; SymIndex: 1; Part Name: RES 4.70K OHM 1/10W 1% 0603 SMD; Part Number: ERJ-3EKF4701V
R101 = RES 4.70K OHM 1/10W 1% 0603 SMD: ERJ-3EKF4701V; Part Label: 4,7K; Cell Name: 0603-STANDART-1608; CmpIndex: 450; Ref Designator: R101; Symbol name: R-SXEM-1.1; SymIndex: 1; Part Name: RES 4.70K OHM 1/10W 1% 0603 SMD; Part Number: ERJ-3EKF4701V
R104 = RES 0.0 OHM 1/4W JUMP 1210 SMD: MCR25JZHJ000; Part Label: 0R; Cell Name: 1210-STANDART-3225; CmpIndex: 817; Ref Designator: R104; Symbol name: R-SXEM-1.1; SymIndex: 1; Part Name: RES 0.0 OHM 1/4W JUMP 1210 SMD; Part Number: MCR25JZHJ000
R105 = RES 0.0 OHM 1/4W JUMP 1210 SMD: MCR25JZHJ000; Part Label: 0R; Cell Name: 1210-STANDART-3225; CmpIndex: 818; Ref Designator: R105; Symbol name: R-SXEM-1.1; SymIndex: 1; Part Name: RES 0.0 OHM 1/4W JUMP 1210 SMD; Part Number: MCR25JZHJ000
R106 = RES 0.0 OHM 1/4W JUMP 1210 SMD: MCR25JZHJ000; Part Label: 0R; Cell Name: 1210-STANDART-3225; CmpIndex: 351; Ref Designator: R106; Symbol name: R-SXEM-1.1; SymIndex: 1; Part Name: RES 0.0 OHM 1/4W JUMP 1210 SMD; Part Number: MCR25JZHJ000
R107 = RES 0.0 OHM 1/4W JUMP 1210 SMD: MCR25JZHJ000; Part Label: 0R; Cell Name: 1210-STANDART-3225; CmpIndex: 131; Ref Designator: R107; Symbol name: R-SXEM-1.1; SymIndex: 1; Part Name: RES 0.0 OHM 1/4W JUMP 1210 SMD; Part Number: MCR25JZHJ000
R142 = RES 620 OHM 1/10W 1% 0603 SMD: ERJ-3EKF6200V; Part Label: 620R; Cell Name: 0603-STANDART-1608; CmpIndex: 882; Ref Designator: R142; Symbol name: R-SXEM-1.1; SymIndex: 1; Part Name: RES 620 OHM 1/10W 1% 0603 SMD; Part Number: ERJ-3EKF6200V
R143 = RES 620 OHM 1/10W 1% 0603 SMD: ERJ-3EKF6200V; Part Label: 620R; Cell Name: 0603-STANDART-1608; CmpIndex: 885; Ref Designator: R143; Symbol name: R-SXEM-1.1; SymIndex: 1; Part Name: RES 620 OHM 1/10W 1% 0603 SMD; Part Number: ERJ-3EKF6200V
R144 = RES 620 OHM 1/10W 1% 0603 SMD: ERJ-3EKF6200V; Part Label: 620R; Cell Name: 0603-STANDART-1608; CmpIndex: 983; Ref Designator: R144; Symbol name: R-SXEM-1.1; SymIndex: 1; Part Name: RES 620 OHM 1/10W 1% 0603 SMD; Part Number: ERJ-3EKF6200V
R145 = RES 620 OHM 1/10W 1% 0603 SMD: ERJ-3EKF6200V; Part Label: 620R; Cell Name: 0603-STANDART-1608; CmpIndex: 1013; Ref Designator: R145; Symbol name: R-SXEM-1.1; SymIndex: 1; Part Name: RES 620 OHM 1/10W 1% 0603 SMD; Part Number: ERJ-3EKF6200V
R146 = RES 620 OHM 1/10W 1% 0603 SMD: ERJ-3EKF6200V; Part Label: 620R; Cell Name: 0603-STANDART-1608; CmpIndex: 1036; Ref Designator: R146; Symbol name: R-SXEM-1.1; SymIndex: 1; Part Name: RES 620 OHM 1/10W 1% 0603 SMD; Part Number: ERJ-3EKF6200V
R147 = RES 620 OHM 1/10W 1% 0603 SMD: ERJ-3EKF6200V; Part Label: 620R; Cell Name: 0603-STANDART-1608; CmpIndex: 1038; Ref Designator: R147; Symbol name: R-SXEM-1.1; SymIndex: 1; Part Name: RES 620 OHM 1/10W 1% 0603 SMD; Part Number: ERJ-3EKF6200V
R148 = RES 620 OHM 1/10W 1% 0603 SMD: ERJ-3EKF6200V; Part Label: 620R; Cell Name: 0603-STANDART-1608; CmpIndex: 451; Ref Designator: R148; Symbol name: R-SXEM-1.1; SymIndex: 1; Part Name: RES 620 OHM 1/10W 1% 0603 SMD; Part Number: ERJ-3EKF6200V
R149 = RES 620 OHM 1/10W 1% 0603 SMD: ERJ-3EKF6200V; Part Label: 620R; Cell Name: 0603-STANDART-1608; CmpIndex: 454; Ref Designator: R149; Symbol name: R-SXEM-1.1; SymIndex: 1; Part Name: RES 620 OHM 1/10W 1% 0603 SMD; Part Number: ERJ-3EKF6200V
R150 = RES 619 OHM 1/10W 1% 0603 SMD: ERJ-3EKF6190V; Part Label: 619R; Cell Name: 0603-STANDART-1608; CmpIndex: 266; Ref Designator: R150; Symbol name: R-SXEM-1.1; SymIndex: 1; Part Name: RES 619 OHM 1/10W 1% 0603 SMD; Part Number: ERJ-3EKF6190V
R151 = RES 619 OHM 1/10W 1% 0603 SMD: ERJ-3EKF6190V; Part Label: 619R; Cell Name: 0603-STANDART-1608; CmpIndex: 268; Ref Designator: R151; Symbol name: R-SXEM-1.1; SymIndex: 1; Part Name: RES 619 OHM 1/10W 1% 0603 SMD; Part Number: ERJ-3EKF6190V
R152 = RES 619 OHM 1/10W 1% 0603 SMD: ERJ-3EKF6190V; Part Label: 619R; Cell Name: 0603-STANDART-1608; CmpIndex: 269; Ref Designator: R152; Symbol name: R-SXEM-1.1; SymIndex: 1; Part Name: RES 619 OHM 1/10W 1% 0603 SMD; Part Number: ERJ-3EKF6190V
R153 = RES 619 OHM 1/10W 1% 0603 SMD: ERJ-3EKF6190V; Part Label: 619R; Cell Name: 0603-STANDART-1608; CmpIndex: 270; Ref Designator: R153; Symbol name: R-SXEM-1.1; SymIndex: 1; Part Name: RES 619 OHM 1/10W 1% 0603 SMD; Part Number: ERJ-3EKF6190V
R154 = RES 619 OHM 1/10W 1% 0603 SMD: ERJ-3EKF6190V; Part Label: 619R; Cell Name: 0603-STANDART-1608; CmpIndex: 271; Ref Designator: R154; Symbol name: R-SXEM-1.1; SymIndex: 1; Part Name: RES 619 OHM 1/10W 1% 0603 SMD; Part Number: ERJ-3EKF6190V
R155 = RES 619 OHM 1/10W 1% 0603 SMD: ERJ-3EKF6190V; Part Label: 619R; Cell Name: 0603-STANDART-1608; CmpIndex: 272; Ref Designator: R155; Symbol name: R-SXEM-1.1; SymIndex: 1; Part Name: RES 619 OHM 1/10W 1% 0603 SMD; Part Number: ERJ-3EKF6190V
R156 = RES 619 OHM 1/10W 1% 0603 SMD: ERJ-3EKF6190V; Part Label: 619R; Cell Name: 0603-STANDART-1608; CmpIndex: 273; Ref Designator: R156; Symbol name: R-SXEM-1.1; SymIndex: 1; Part Name: RES 619 OHM 1/10W 1% 0603 SMD; Part Number: ERJ-3EKF6190V
R157 = RES 619 OHM 1/10W 1% 0603 SMD: ERJ-3EKF6190V; Part Label: 619R; Cell Name: 0603-STANDART-1608; CmpIndex: 274; Ref Designator: R157; Symbol name: R-SXEM-1.1; SymIndex: 1; Part Name: RES 619 OHM 1/10W 1% 0603 SMD; Part Number: ERJ-3EKF6190V
R158 = RES 619 OHM 1/10W 1% 0603 SMD: ERJ-3EKF6190V; Part Label: 619R; Cell Name: 0603-STANDART-1608; CmpIndex: 282; Ref Designator: R158; Symbol name: R-SXEM-1.1; SymIndex: 1; Part Name: RES 619 OHM 1/10W 1% 0603 SMD; Part Number: ERJ-3EKF6190V
R159 = RES 619 OHM 1/10W 1% 0603 SMD: ERJ-3EKF6190V; Part Label: 619R; Cell Name: 0603-STANDART-1608; CmpIndex: 313; Ref Designator: R159; Symbol name: R-SXEM-1.1; SymIndex: 1; Part Name: RES 619 OHM 1/10W 1% 0603 SMD; Part Number: ERJ-3EKF6190V
R160 = RES 619 OHM 1/10W 1% 0603 SMD: ERJ-3EKF6190V; Part Label: 619R; Cell Name: 0603-STANDART-1608; CmpIndex: 314; Ref Designator: R160; Symbol name: R-SXEM-1.1; SymIndex: 1; Part Name: RES 619 OHM 1/10W 1% 0603 SMD; Part Number: ERJ-3EKF6190V
R161 = RES 619 OHM 1/10W 1% 0603 SMD: ERJ-3EKF6190V; Part Label: 619R; Cell Name: 0603-STANDART-1608; CmpIndex: 315; Ref Designator: R161; Symbol name: R-SXEM-1.1; SymIndex: 1; Part Name: RES 619 OHM 1/10W 1% 0603 SMD; Part Number: ERJ-3EKF6190V
R162 = RES 619 OHM 1/10W 1% 0603 SMD: ERJ-3EKF6190V; Part Label: 619R; Cell Name: 0603-STANDART-1608; CmpIndex: 316; Ref Designator: R162; Symbol name: R-SXEM-1.1; SymIndex: 1; Part Name: RES 619 OHM 1/10W 1% 0603 SMD; Part Number: ERJ-3EKF6190V
R163 = RES 619 OHM 1/10W 1% 0603 SMD: ERJ-3EKF6190V; Part Label: 619R; Cell Name: 0603-STANDART-1608; CmpIndex: 317; Ref Designator: R163; Symbol name: R-SXEM-1.1; SymIndex: 1; Part Name: RES 619 OHM 1/10W 1% 0603 SMD; Part Number: ERJ-3EKF6190V
R164 = RES 619 OHM 1/10W 1% 0603 SMD: ERJ-3EKF6190V; Part Label: 619R; Cell Name: 0603-STANDART-1608; CmpIndex: 318; Ref Designator: R164; Symbol name: R-SXEM-1.1; SymIndex: 1; Part Name: RES 619 OHM 1/10W 1% 0603 SMD; Part Number: ERJ-3EKF6190V
R165 = RES 619 OHM 1/10W 1% 0603 SMD: ERJ-3EKF6190V; Part Label: 619R; Cell Name: 0603-STANDART-1608; CmpIndex: 350; Ref Designator: R165; Symbol name: R-SXEM-1.1; SymIndex: 1; Part Name: RES 619 OHM 1/10W 1% 0603 SMD; Part Number: ERJ-3EKF6190V
R166 = RES 200 OHM 1/10W 1% 0603 SMD: ERJ-3EKF2000V; Part Label: 200R; Cell Name: 0603-STANDART-1608; CmpIndex: 277; Ref Designator: R166; Symbol name: R-SXEM-1.1; SymIndex: 1; Part Name: RES 200 OHM 1/10W 1% 0603 SMD; Part Number: ERJ-3EKF2000V
R167 = RES 200 OHM 1/10W 1% 0603 SMD: ERJ-3EKF2000V; Part Label: 200R; Cell Name: 0603-STANDART-1608; CmpIndex: 278; Ref Designator: R167; Symbol name: R-SXEM-1.1; SymIndex: 1; Part Name: RES 200 OHM 1/10W 1% 0603 SMD; Part Number: ERJ-3EKF2000V
R168 = RES 200 OHM 1/10W 1% 0603 SMD: ERJ-3EKF2000V; Part Label: 200R; Cell Name: 0603-STANDART-1608; CmpIndex: 281; Ref Designator: R168; Symbol name: R-SXEM-1.1; SymIndex: 1; Part Name: RES 200 OHM 1/10W 1% 0603 SMD; Part Number: ERJ-3EKF2000V
R169 = RES 200 OHM 1/10W 1% 0603 SMD: ERJ-3EKF2000V; Part Label: 200R; Cell Name: 0603-STANDART-1608; CmpIndex: 283; Ref Designator: R169; Symbol name: R-SXEM-1.1; SymIndex: 1; Part Name: RES 200 OHM 1/10W 1% 0603 SMD; Part Number: ERJ-3EKF2000V
R170 = RES 200 OHM 1/10W 1% 0603 SMD: ERJ-3EKF2000V; Part Label: 200R; Cell Name: 0603-STANDART-1608; CmpIndex: 360; Ref Designator: R170; Symbol name: R-SXEM-1.1; SymIndex: 1; Part Name: RES 200 OHM 1/10W 1% 0603 SMD; Part Number: ERJ-3EKF2000V
R171 = RES 200 OHM 1/10W 1% 0603 SMD: ERJ-3EKF2000V; Part Label: 200R; Cell Name: 0603-STANDART-1608; CmpIndex: 361; Ref Designator: R171; Symbol name: R-SXEM-1.1; SymIndex: 1; Part Name: RES 200 OHM 1/10W 1% 0603 SMD; Part Number: ERJ-3EKF2000V
R172 = RES 200 OHM 1/10W 1% 0603 SMD: ERJ-3EKF2000V; Part Label: 200R; Cell Name: 0603-STANDART-1608; CmpIndex: 363; Ref Designator: R172; Symbol name: R-SXEM-1.1; SymIndex: 1; Part Name: RES 200 OHM 1/10W 1% 0603 SMD; Part Number: ERJ-3EKF2000V
R185 = RES 0.0 OHM 1/10W 0603 SMD: ERJ-3GEY0R00V; Part Label: 0R; Cell Name: 0603-STANDART-1608; CmpIndex: 1015; Ref Designator: R185; Symbol name: R-SXEM-1.1; SymIndex: 1; Part Name: RES 0.0 OHM 1/10W 0603 SMD; Part Number: ERJ-3GEY0R00V
R186 = RES 0.0 OHM 1/10W 0603 SMD: ERJ-3GEY0R00V; Part Label: 0R; Cell Name: 0603-STANDART-1608; CmpIndex: 1062; Ref Designator: R186; Symbol name: R-SXEM-1.1; SymIndex: 1; Part Name: RES 0.0 OHM 1/10W 0603 SMD; Part Number: ERJ-3GEY0R00V
R187 = RES 0.0 OHM 1/10W 0603 SMD: ERJ-3GEY0R00V; Part Label: 0R; Cell Name: 0603-STANDART-1608; CmpIndex: 1072; Ref Designator: R187; Symbol name: R-SXEM-1.1; SymIndex: 1; Part Name: RES 0.0 OHM 1/10W 0603 SMD; Part Number: ERJ-3GEY0R00V
R188 = RES 0.0 OHM 1/10W 0603 SMD: ERJ-3GEY0R00V; Part Label: 0R; Cell Name: 0603-STANDART-1608; CmpIndex: 1084; Ref Designator: R188; Symbol name: R-SXEM-1.1; SymIndex: 1; Part Name: RES 0.0 OHM 1/10W 0603 SMD; Part Number: ERJ-3GEY0R00V
R189 = RES 0.0 OHM 1/10W 0603 SMD: ERJ-3GEY0R00V; Part Label: 0R; Cell Name: 0603-STANDART-1608; CmpIndex: 453; Ref Designator: R189; Symbol name: R-SXEM-1.1; SymIndex: 1; Part Name: RES 0.0 OHM 1/10W 0603 SMD; Part Number: ERJ-3GEY0R00V
R190 = RES 0.0 OHM 1/10W 0603 SMD: ERJ-3GEY0R00V; Part Label: 0R; Cell Name: 0603-STANDART-1608; CmpIndex: 456; Ref Designator: R190; Symbol name: R-SXEM-1.1; SymIndex: 1; Part Name: RES 0.0 OHM 1/10W 0603 SMD; Part Number: ERJ-3GEY0R00V
R191 = RES 0.0 OHM 1/10W 0603 SMD: ERJ-3GEY0R00V; Part Label: 0R; Cell Name: 0603-STANDART-1608; CmpIndex: 469; Ref Designator: R191; Symbol name: R-SXEM-1.1; SymIndex: 1; Part Name: RES 0.0 OHM 1/10W 0603 SMD; Part Number: ERJ-3GEY0R00V
R192 = RES 0.0 OHM 1/10W 0603 SMD: ERJ-3GEY0R00V; Part Label: 0R; Cell Name: 0603-STANDART-1608; CmpIndex: 471; Ref Designator: R192; Symbol name: R-SXEM-1.1; SymIndex: 1; Part Name: RES 0.0 OHM 1/10W 0603 SMD; Part Number: ERJ-3GEY0R00V
R202 = RES 10.7 OHM 1/10W 1% 0603 SMD: ERJ-3EKF10R7V; Part Label: 10,7R; Cell Name: 0603-STANDART-1608; CmpIndex: 431; Ref Designator: R202; Symbol name: R-SXEM-1.1; SymIndex: 1; Part Name: RES 10.7 OHM 1/10W 1% 0603 SMD; Part Number: ERJ-3EKF10R7V
R203 = RES 10.7 OHM 1/10W 1% 0603 SMD: ERJ-3EKF10R7V; Part Label: 10,7R; Cell Name: 0603-STANDART-1608; CmpIndex: 433; Ref Designator: R203; Symbol name: R-SXEM-1.1; SymIndex: 1; Part Name: RES 10.7 OHM 1/10W 1% 0603 SMD; Part Number: ERJ-3EKF10R7V
R243 = RES 10.0 OHM 1/10W 1% 0603 SMD: ERJ-3EKF10R0V; Part Label: 10R; Cell Name: 0603-STANDART-1608; CmpIndex: 819; Ref Designator: R243; Symbol name: R-SXEM-1.1; SymIndex: 1; Part Name: RES 10.0 OHM 1/10W 1% 0603 SMD; Part Number: ERJ-3EKF10R0V
R244 = RES 10.0 OHM 1/10W 1% 0603 SMD: ERJ-3EKF10R0V; Part Label: 10R; Cell Name: 0603-STANDART-1608; CmpIndex: 826; Ref Designator: R244; Symbol name: R-SXEM-1.1; SymIndex: 1; Part Name: RES 10.0 OHM 1/10W 1% 0603 SMD; Part Number: ERJ-3EKF10R0V
R245 = RES 10.0 OHM 1/10W 1% 0603 SMD: ERJ-3EKF10R0V; Part Label: 10R; Cell Name: 0603-STANDART-1608; CmpIndex: 1058; Ref Designator: R245; Symbol name: R-SXEM-1.1; SymIndex: 1; Part Name: RES 10.0 OHM 1/10W 1% 0603 SMD; Part Number: ERJ-3EKF10R0V
R246 = RES 10.0 OHM 1/10W 1% 0603 SMD: ERJ-3EKF10R0V; Part Label: 10R; Cell Name: 0603-STANDART-1608; CmpIndex: 1059; Ref Designator: R246; Symbol name: R-SXEM-1.1; SymIndex: 1; Part Name: RES 10.0 OHM 1/10W 1% 0603 SMD; Part Number: ERJ-3EKF10R0V
R257 = RES 3.40K OHM 1/10W 1% 0603 SMD: ERJ-3EKF3401V; Part Label: 3,4K; Cell Name: 0603-STANDART-1608; CmpIndex: 831; Ref Designator: R257; Symbol name: R-SXEM-1.1; SymIndex: 1; Part Name: RES 3.40K OHM 1/10W 1% 0603 SMD; Part Number: ERJ-3EKF3401V
R258 = RES 470 OHM 1/8W 5% 0805 SMD: ERJ-6GEYJ471V; Part Label: 470R; Cell Name: 0805-STANDART-2012; CmpIndex: 998; Ref Designator: R258; Symbol name: R-SXEM-1.1; SymIndex: 1; Part Name: RES 470 OHM 1/8W 5% 0805 SMD; Part Number: ERJ-6GEYJ471V
R259 = RES 2.40K OHM 1/8W 1% 0805 SMD: ERJ-6ENF2401V; Part Label: 2,4K; Cell Name: 0805-STANDART-2012; CmpIndex: 1001; Ref Designator: R259; Symbol name: R-SXEM-1.1; SymIndex: 1; Part Name: RES 2.40K OHM 1/8W 1% 0805 SMD; Part Number: ERJ-6ENF2401V
TP5 = TEST POINT PC MULTI PURPOSE BLK: 5011; Cell Name: TEST-POINTS-1; CmpIndex: 223; Ref Designator: TP5; Symbol name: TEST-POINTS-4.1; SymIndex: 9; Part Name: TEST POINT PC MULTI PURPOSE BLK; Part Number: 5011
TP6 = TEST POINT PC MULTI PURPOSE RED: 5010; Cell Name: TEST-POINTS-1; CmpIndex: 27; Ref Designator: TP6; Symbol name: TEST-POINTS-4.1; SymIndex: 9; Part Name: TEST POINT PC MULTI PURPOSE RED; Part Number: 5010
TP7 = TEST POINT PC MULTI PURPOSE RED: 5010; Cell Name: TEST-POINTS-1; CmpIndex: 220; Ref Designator: TP7; Symbol name: TEST-POINTS-4.1; SymIndex: 9; Part Name: TEST POINT PC MULTI PURPOSE RED; Part Number: 5010